# Altium project Rover_Arm.PrjPcb
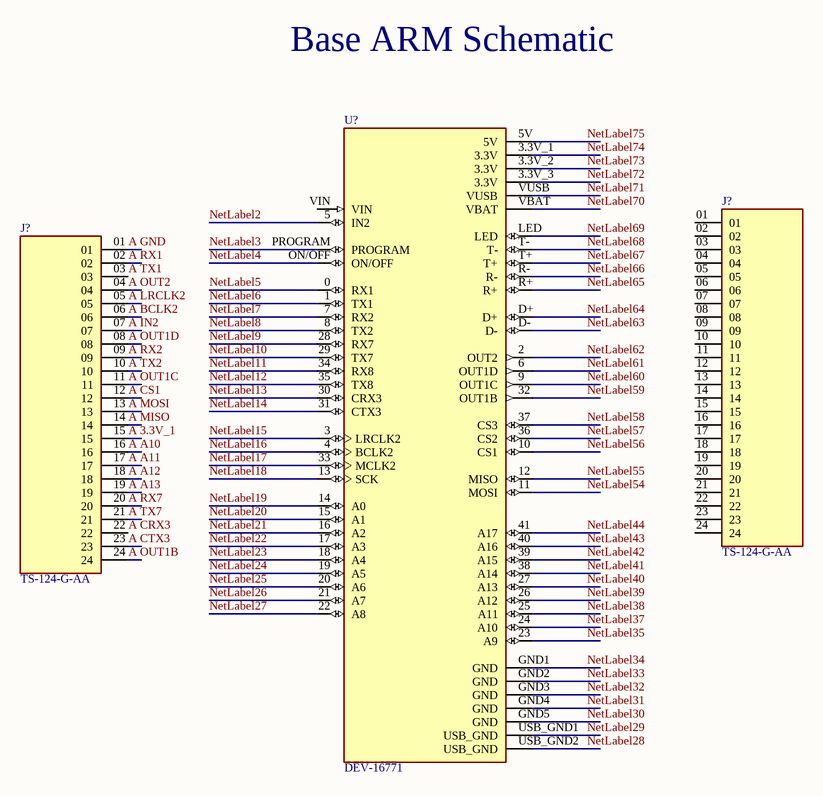
[diagram p0: Sheet1.SchDoc]
1 sheet, 3 parts. Net scope: global (net labels, ports and power ports of the same name join across sheets).
Board file: PCB1.PcbDoc

## Sheet Sheet1.SchDoc
size A4; SheetNumber: 1; SheetTotal: 1

### Parts
(Parts that share a designator on the sheet are numbered #1, #2 ... from top to bottom, then left to right.)
J?#1  TS-124-G-AA  [SAMTEC_TS-124-G-AA]
J?#2  TS-124-G-AA  [SAMTEC_TS-124-G-AA]
U?  DEV-16771  [MODULE_DEV-16771]

### Nets
A 3.3V_1: J?#2.15
A A10: J?#2.16
A A11: J?#2.17
A A12: J?#2.18
A A13: J?#2.19
A BCLK2: J?#2.06
A CRX3: J?#2.22
A CS1: J?#2.12
A CTX3: J?#2.23
A GND: J?#2.01
A IN2: J?#2.07
A LRCLK2: J?#2.05
A MISO: J?#2.14
A MOSI: J?#2.13
A OUT1B: J?#2.24
A OUT1C: J?#2.11
A OUT1D: J?#2.08
A OUT2: J?#2.04
A RX1 : J?#2.02
A RX2: J?#2.09
A RX7: J?#2.20
A TX1: J?#2.03
A TX2: J?#2.10
A TX7: J?#2.21
NetLabel2: U?.5(IN2)
NetLabel3: U?.PROGRAM
NetLabel4: U?.ON/OFF
NetLabel5: U?.0(RX1)
NetLabel6: U?.1(TX1)
NetLabel7: U?.7(RX2)
NetLabel8: U?.8(TX2)
NetLabel9: U?.28(RX7)
NetLabel10: U?.29(TX7)
NetLabel11: U?.34(RX8)
NetLabel12: U?.35(TX8)
NetLabel13: U?.30(CRX3)
NetLabel14: U?.31(CTX3)
NetLabel15: U?.3(LRCLK2)
NetLabel16: U?.4(BCLK2)
NetLabel17: U?.33(MCLK2)
NetLabel18: U?.13(SCK)
NetLabel19: U?.14(A0)
NetLabel20: U?.15(A1)
NetLabel21: U?.16(A2)
NetLabel22: U?.17(A3)
NetLabel23: U?.18(A4)
NetLabel24: U?.19(A5)
NetLabel25: U?.20(A6)
NetLabel26: U?.21(A7)
NetLabel27: U?.22(A8)
NetLabel28: U?.USB_GND2(USB_GND)
NetLabel29: U?.USB_GND1(USB_GND)
NetLabel30: U?.GND5(GND)
NetLabel31: U?.GND4(GND)
NetLabel32: U?.GND3(GND)
NetLabel33: U?.GND2(GND)
NetLabel34: U?.GND1(GND)
NetLabel35: U?.23(A9)
NetLabel37: U?.24(A10)
NetLabel38: U?.25(A11)
NetLabel39: U?.26(A12)
NetLabel40: U?.27(A13)
NetLabel41: U?.38(A14)
NetLabel42: U?.39(A15)
NetLabel43: U?.40(A16)
NetLabel44: U?.41(A17)
NetLabel54: U?.11(MOSI)
NetLabel55: U?.12(MISO)
NetLabel56: U?.10(CS1)
NetLabel57: U?.36(CS2)
NetLabel58: U?.37(CS3)
NetLabel59: U?.32(OUT1B)
NetLabel60: U?.9(OUT1C)
NetLabel61: U?.6(OUT1D)
NetLabel62: U?.2(OUT2)
NetLabel63: U?.D-
NetLabel64: U?.D+
NetLabel65: U?.R+
NetLabel66: U?.R-
NetLabel67: U?.T+
NetLabel68: U?.T-
NetLabel69: U?.LED
NetLabel70: U?.VBAT
NetLabel71: U?.VUSB
NetLabel72: U?.3.3V_3(3.3V)
NetLabel73: U?.3.3V_2(3.3V)
NetLabel74: U?.3.3V_1(3.3V)
NetLabel75: U?.5V

Not connected (* = marked no-connect by the designer): J?#1 01 02 03 04 05 06 07 08 09 10 11 12 13 14 15 16 17 18 19 20 21 22 23 24; U? VIN

### Notes on the sheet
- Base ARM Schematic

### Library data of the parts
J?#1 J?#2 = CMP-002-00081-1: CONN HDR .100 24POS; MF: Samtec; Pins: 24; SnapEDA_Link: https://www.snapeda.com/parts/TS-124-G-AA/Samtec/view-part/?ref=snap; Check_prices: https://www.snapeda.com/parts/TS-124-G-AA/Samtec/view-part/?ref=eda; Availability: In Stock; MP: TS-124-G-AA; Value: *; Price: None; Purchase-URL: https://pricing.snapeda.com/search/part/TS-124-G-AA/?ref=eda; Component Type: Standard; Source: TS-124-G-AA.SchLib; Case/Package: None; Design Item ID: TS-124-G-AA
U? = CMP-023-000000-1: RT1062 Teensy 4.1 series ARM® Cortex®-M7 MPU Embedded Evaluation Board; MF: SparkFun Electronics; Value: *; Check_prices: https://www.snapeda.com/parts/DEV-16771/SparkFun+Electronics/view-part/?ref=eda; Component Type: Standard; Pin Count: 65; Package: None; MP: DEV-16771; Source: DEV-16771.SchLib; SnapEDA_Link: https://www.snapeda.com/parts/DEV-16771/SparkFun+Electronics/view-part/?ref=snap; Design Item ID: DEV-16771